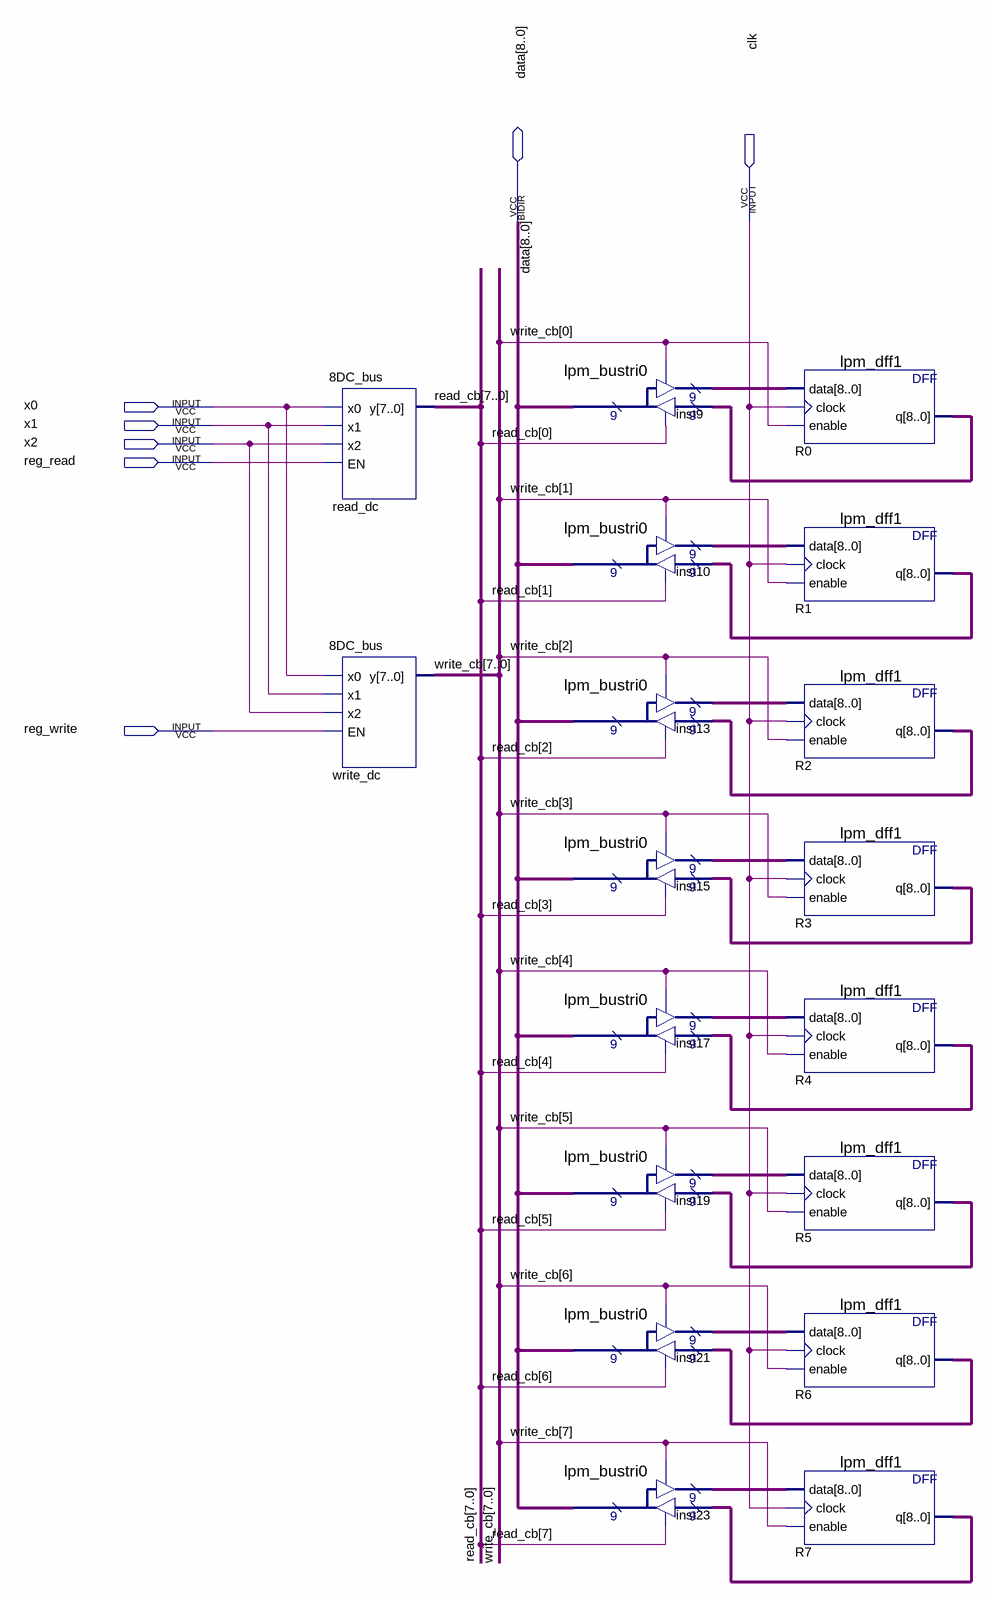
[diagram p0: schematic sheet]
// Quartus schematic RON.bdf as structural Verilog: 18 symbols, 7 pins
module RON (
  input  clk,
  input  x0,
  input  x1,
  input  x2,
  input  reg_read,
  input  reg_write,
  inout  [8:0] data
);

  wire [7:0] read_cb, write_cb;
  wire [8:0] inst9_result, inst10_result, inst13_result, inst15_result, inst17_result, inst19_result,
       inst21_result, inst23_result, R0_q, R1_q, R2_q, R3_q, R4_q, R5_q, R6_q, R7_q;

  \8DC_bus  read_dc (.x0(x0), .x1(x1), .x2(x2), .EN(reg_read), .y(read_cb));
  \8DC_bus  write_dc (.x0(x0), .x1(x1), .x2(x2), .EN(reg_write), .y(write_cb));
  lpm_bustri0 inst9 (.enabledt(read_cb[0]), .data(R0_q), .enabletr(write_cb[0]), .result(inst9_result), .tridata(data));
  lpm_bustri0 inst10 (
    .enabledt(read_cb[1]), .data(R1_q), .enabletr(write_cb[1]), .result(inst10_result), .tridata(data));
  lpm_bustri0 inst13 (
    .enabledt(read_cb[2]), .data(R2_q), .enabletr(write_cb[2]), .result(inst13_result), .tridata(data));
  lpm_bustri0 inst15 (
    .enabledt(read_cb[3]), .data(R3_q), .enabletr(write_cb[3]), .result(inst15_result), .tridata(data));
  lpm_bustri0 inst17 (
    .enabledt(read_cb[4]), .data(R4_q), .enabletr(write_cb[4]), .result(inst17_result), .tridata(data));
  lpm_bustri0 inst19 (
    .enabledt(read_cb[5]), .data(R5_q), .enabletr(write_cb[5]), .result(inst19_result), .tridata(data));
  lpm_bustri0 inst21 (
    .enabledt(read_cb[6]), .data(R6_q), .enabletr(write_cb[6]), .result(inst21_result), .tridata(data));
  lpm_bustri0 inst23 (
    .enabledt(read_cb[7]), .data(R7_q), .enabletr(write_cb[7]), .result(inst23_result), .tridata(data));
  lpm_dff1 R0 (.data(inst9_result), .clock(clk), .enable(write_cb[0]), .q(R0_q));
  lpm_dff1 R1 (.data(inst10_result), .clock(clk), .enable(write_cb[1]), .q(R1_q));
  lpm_dff1 R2 (.data(inst13_result), .clock(clk), .enable(write_cb[2]), .q(R2_q));
  lpm_dff1 R3 (.data(inst15_result), .clock(clk), .enable(write_cb[3]), .q(R3_q));
  lpm_dff1 R4 (.data(inst17_result), .clock(clk), .enable(write_cb[4]), .q(R4_q));
  lpm_dff1 R5 (.data(inst19_result), .clock(clk), .enable(write_cb[5]), .q(R5_q));
  lpm_dff1 R6 (.data(inst21_result), .clock(clk), .enable(write_cb[6]), .q(R6_q));
  lpm_dff1 R7 (.data(inst23_result), .clock(clk), .enable(write_cb[7]), .q(R7_q));
endmodule
